# Altium schematic sheet LCD_backlight_power.SchDoc
size A3; SheetNumber: 2; SheetTotal: 3; SPICEModelCacheZVVUEIQZ: <root> / <DocumentId>ZVVUEIQZ</DocumentId> / <CacheFrame Number="0"> / <Model Name="skydiode" Kind="MDL"> / <Text>*Default Schottky Diode / *Schottky Diode Pinout: A,K / .MODEL SKYDIODE D(EG=0.69 XTI=2)</Text> / </Model> / </CacheFrame> / </root>
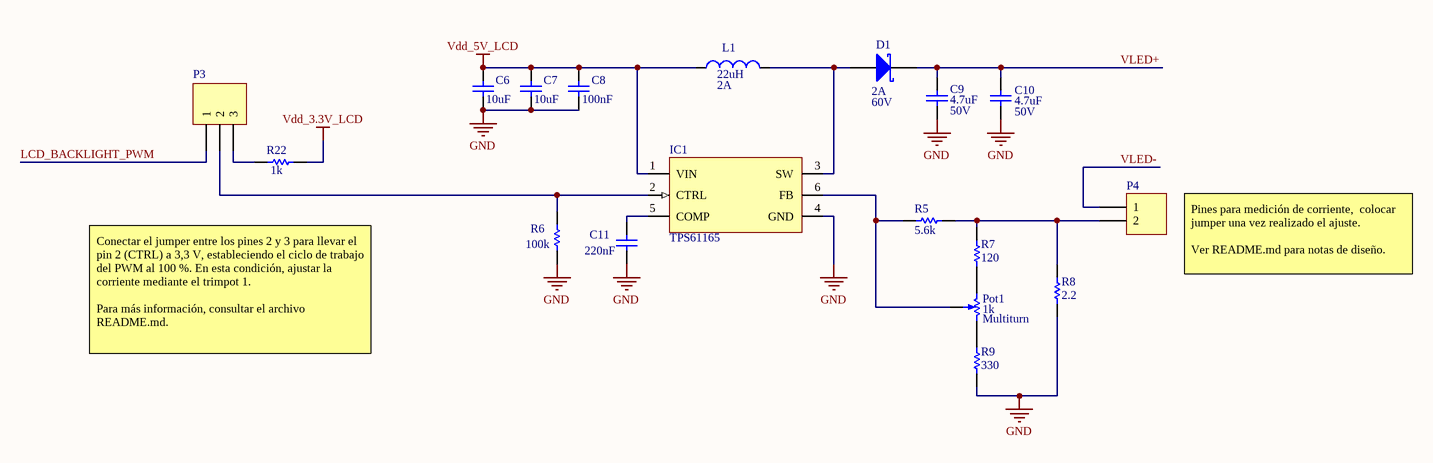
[diagram p0: LCD_backlight_power.SchDoc]

## Parts
C6  value 10uF  [capacitor 0805]  (hidden comment: ceramic capacitor)
C7  value 10uF  [capacitor 0805]  (hidden comment: ceramic capacitor)
C8  value 100nF  [capacitor 0805]  (hidden comment: ceramic capacitor)
C9  value 4.7uF  V: 50V  [capacitor 1206]  (hidden comment: ceramic capacitor)
C10  value 4.7uF  V: 50V  [capacitor 1206]  (hidden comment: ceramic capacitor)
C11  value 220nF  [capacitor 0805]  (hidden comment: ceramic capacitor)
D1  current: 2A  voltage: 60V  [DO-214AC]  (hidden comment: D Schottky)
IC1  TPS61165  [sot-23 (6)]
L1  value 22uH  Irms: 2A  [Inductor SMD 6.6 x 7.3 x 4]  (hidden comment: Inductor)
P3  Header 3  [HDR1X3]  (value not drawn)
P4  Header 2  [HDR1X2]  (value not drawn)
Pot1  Multiturn  value 1k  [trim pot 3296W]
R5  value 5.6k  [resistor 0603]  (hidden comment: Resistor)
R6  value 100k  [resistor 0603]  (hidden comment: Resistor)
R7  value 120  [resistor 0805]  (hidden comment: Resistor)
R8  value 2.2  [resistor 2512]  (hidden comment: Resistor)
R9  value 330  [resistor 0805]  (hidden comment: Resistor)
R22  value 1k  [resistor 0603]  (hidden comment: Resistor)

## Nets
GND: C6.2 C7.2 C8.2 C9.2 C10.2 C11.2 IC1.4(GND) R6.2 R8.1 R9.2
Vdd_3.3V_LCD: R22.2
Vdd_5V_LCD: C6.1 C7.1 C8.1 IC1.1(VIN) L1.1
LCD_BACKLIGHT_PWM: P3.1
VLED+: C9.1 C10.1 D1.2(K)
VLED-: P4.1
NetC11_1: C11.1 IC1.5(COMP)
NetD1_1: D1.1(A) IC1.3(SW) L1.2
NetIC1_2: IC1.2(CTRL) P3.2 R6.1
NetIC1_6: IC1.6(FB) Pot1.W R5.2
NetP3_3: P3.3 R22.1
NetP4_2: P4.2 R5.1 R7.1 R8.2
NetPot1_CCW: Pot1.CCW(-) R9.1
NetPot1_CW: Pot1.CW(+) R7.2

## Notes on the sheet
- Pines para medición de corriente,  colocar jumper una vez realizado el ajuste.
  Ver README.md para notas de diseño.
- Conectar el jumper entre los pines 2 y 3 para llevar el pin 2 (CTRL) a 3,3 V, estableciendo el ciclo de trabajo del PWM al 100 %. En esta condición, ajustar la corriente mediante el trimpot 1.
  Para más información, consultar el archivo README.md.

## Library data of the parts
C6 C7 = ceramic capacitor: Multilayer ceramic capacitor; V: 25; Material: X5R; LCSC part: C15850; Package: 0805
C8 = ceramic capacitor: Multilayer ceramic capacitor; V: 50; Material: X7R; LCSC part: C1711; Package: 0805
C9 C10 = ceramic capacitor: Multilayer ceramic capacitor; Material: X7R; LCSC part: C51205; Package: 1206
C11 = ceramic capacitor: Multilayer ceramic capacitor; V: 25; Material: X7R; LCSC part: C5153; Package: 0805
D1 = D Schottky: Schottky Diode; MFR: Vishay Intertech; MFR part: SS26SHE3_B/H; LCSC part: C511359; Package: SMA(DO-214AC)
IC1 = TPS61165: LED Backlighting for LCD display; MFR: Texas Instruments; MFR part: TPS61165DBVR; LCSC part: C58756; Package: SOT-23-6
L1 = Inductor: MFR: YOUCHI; MFR part: HCMA-0630-220-M-K; Isat: 2.5A; Max. DC Resistance: 190mOhm; LCSC part: C54431705; Package: SMD,7.3x6.6mm
P3 = Header 3: Header, 3-Pin; LatestRevisionDate: 17-Jul-2002; LatestRevisionNote: Re-released for DXP Platform.; Publisher: Altium Limited
P4 = Header 2: Header, 2-Pin; LatestRevisionDate: 17-Jul-2002; LatestRevisionNote: Re-released for DXP Platform.; Publisher: Altium Limited
Pot1 = RPot SM: Square Trimming Potentiometer; pin to pad: CCW>3 CW>1 W>2; ComponentLink1Description: Manufacturer Link; ComponentLink1URL: http://bourns.com/2/search.html
R5-R9 R22 = Resistor
  R5 R6 R22: Package: 0603
  R7 R9: Package: 0805
  R8: LCSC part: C55586149; Package: 2512